# Altium schematic sheet Motor Driver.SchDoc
size 347 x 193 mm; SheetNumber: 5; SheetTotal: 5
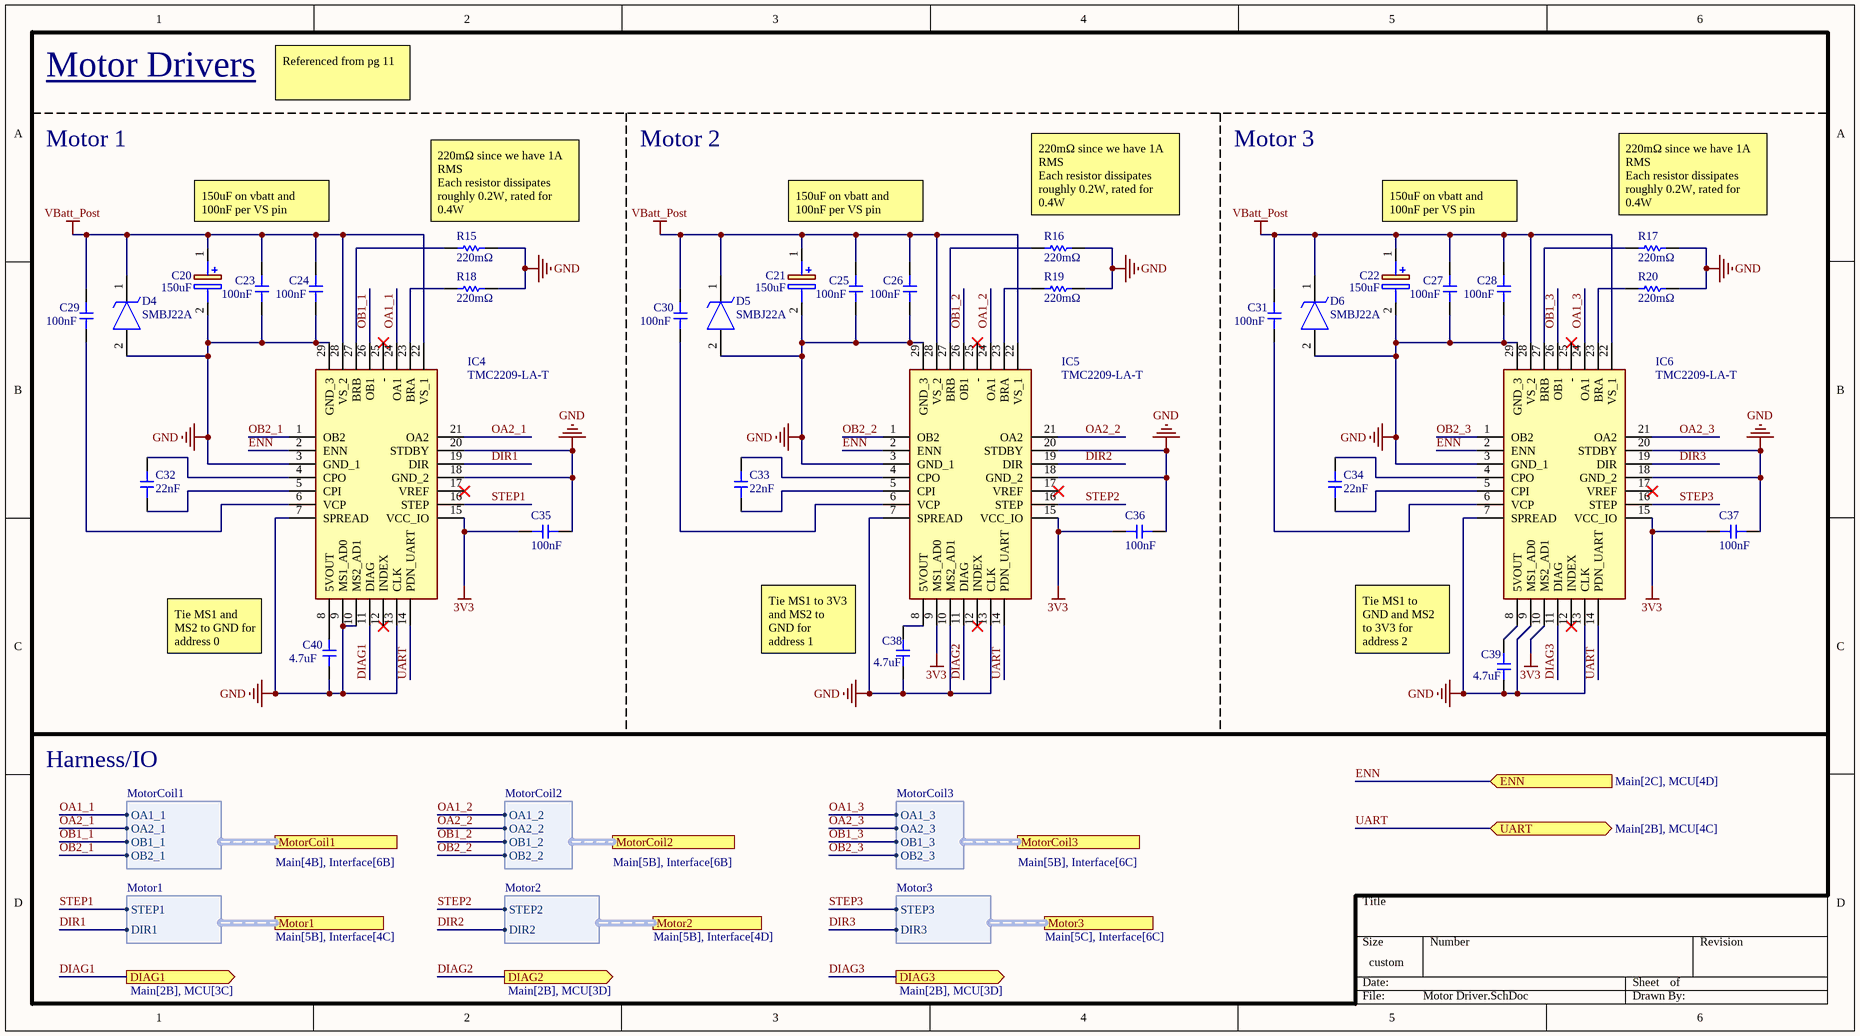
[diagram p0: Motor Driver.SchDoc]

## Parts
C20  150uF  [EEHZA1H680P]
C21  150uF  [EEHZA1H680P]
C22  150uF  [EEHZA1H680P]
C23  Capacitance: 100nF  [CAP-0603]  (hidden comment: CC0603KRX7R9BB104)
C24  Capacitance: 100nF  [CAP-0603]  (hidden comment: CC0603KRX7R9BB104)
C25  Capacitance: 100nF  [CAP-0603]  (hidden comment: CC0603KRX7R9BB104)
C26  Capacitance: 100nF  [CAP-0603]  (hidden comment: CC0603KRX7R9BB104)
C27  Capacitance: 100nF  [CAP-0603]  (hidden comment: CC0603KRX7R9BB104)
C28  Capacitance: 100nF  [CAP-0603]  (hidden comment: CC0603KRX7R9BB104)
C29  Capacitance: 100nF  [CAP-0603]  (hidden comment: CC0603KRX7R9BB104)
C30  Capacitance: 100nF  [CAP-0603]  (hidden comment: CC0603KRX7R9BB104)
C31  Capacitance: 100nF  [CAP-0603]  (hidden comment: CC0603KRX7R9BB104)
C32  Capacitance: 22nF  [CAP-0603]  (hidden comment: CL10B223KB8NNNC)
C33  Capacitance: 22nF  [CAP-0603]  (hidden comment: CL10B223KB8NNNC)
C34  Capacitance: 22nF  [CAP-0603]  (hidden comment: CL10B223KB8NNNC)
C35  Capacitance: 100nF  [CAP-0603]  (hidden comment: CC0603KRX7R9BB104)
C36  Capacitance: 100nF  [CAP-0603]  (hidden comment: CC0603KRX7R9BB104)
C37  Capacitance: 100nF  [CAP-0603]  (hidden comment: CC0603KRX7R9BB104)
C38  Capacitance: 4.7uF  [CAP-0603]  (hidden comment: CL10A475KO8NNNC)
C39  Capacitance: 4.7uF  [CAP-0603]  (hidden comment: CL10A475KO8NNNC)
C40  Capacitance: 4.7uF  [CAP-0603]  (hidden comment: CL10A475KO8NNNC)
D4  SMBJ22A  [SMBJ12A]
D5  SMBJ22A  [SMBJ12A]
D6  SMBJ22A  [SMBJ12A]
IC4  TMC2209-LA-T  [QFN50P500X500X90-29N-D]
IC5  TMC2209-LA-T  [QFN50P500X500X90-29N-D]
IC6  TMC2209-LA-T  [QFN50P500X500X90-29N-D]
R15  220mΩ  [RESC1608X55N]
R16  220mΩ  [RESC1608X55N]
R17  220mΩ  [RESC1608X55N]
R18  220mΩ  [RESC1608X55N]
R19  220mΩ  [RESC1608X55N]
R20  220mΩ  [RESC1608X55N]

## Ports
DIAG1 (out, see Main[2B], MCU[3C]), DIAG2 (out, see Main[2B], MCU[3D]), DIAG3 (out, see Main[2B], MCU[3D]), ENN (in, see Main[2C], MCU[4D]), Motor1 (harness Motor1, see Main[5B], Interface[4C]), Motor2 (harness Motor2, see Main[5B], Interface[4D]), Motor3 (harness Motor3, see Main[5C], Interface[6C]), MotorCoil1 (harness MotorCoil1, see Main[4B], Interface[6B]), MotorCoil2 (harness MotorCoil2, see Main[5B], Interface[6B]), MotorCoil3 (harness MotorCoil3, see Main[5B], Interface[6C]), UART (bidir, see Main[2B], MCU[4C])

## Harnesses
MotorCoil1: OA1_1, OA2_1, OB1_1, OB2_1
MotorCoil2: OA1_2, OA2_2, OB1_2, OB2_2
MotorCoil3: OA1_3, OA2_3, OB1_3, OB2_3
Motor1: STEP1, DIR1
Motor2: STEP2, DIR2
Motor3: STEP3, DIR3

## Nets
3V3: C35.1 C36.1 C37.1 IC4.15(VCC_IO) IC5.9(MS1_AD0) IC5.15(VCC_IO) IC6.10(MS2_AD1) IC6.15(VCC_IO)
GND: C20.2(-) C21.2(-) C22.2(-) C23.1 C24.1 C25.1 C26.1 C27.1 C28.1 C35.2 C36.2 C37.2 C38.1 C39.1 C40.1 D4.2(A) D5.2(A) D6.2(A) IC4.3(GND_1) IC4.7(SPREAD) IC4.9(MS1_AD0) IC4.10(MS2_AD1) IC4.13(CLK) IC4.18(GND_2) IC4.20(STDBY) IC4.29(GND_3) IC5.3(GND_1) IC5.7(SPREAD) IC5.10(MS2_AD1) IC5.13(CLK) IC5.18(GND_2) IC5.20(STDBY) IC5.29(GND_3) IC6.3(GND_1) IC6.7(SPREAD) IC6.9(MS1_AD0) IC6.13(CLK) IC6.18(GND_2) IC6.20(STDBY) IC6.29(GND_3) R15.2 R16.2 R17.2 R18.2 R19.2 R20.2
VBatt_Post: C20.1(+) C21.1(+) C22.1(+) C23.2 C24.2 C25.2 C26.2 C27.2 C28.2 C29.2 C30.2 C31.2 D4.1(K) D5.1(K) D6.1(K) IC4.22(VS_1) IC4.28(VS_2) IC5.22(VS_1) IC5.28(VS_2) IC6.22(VS_1) IC6.28(VS_2)
DIAG1: IC4.11(DIAG) ; port DIAG1
DIAG2: IC5.11(DIAG) ; port DIAG2
DIAG3: IC6.11(DIAG) ; port DIAG3
DIR1: IC4.19(DIR) ; port Motor1.DIR1
DIR2: IC5.19(DIR) ; port Motor2.DIR2
DIR3: IC6.19(DIR) ; port Motor3.DIR3
ENN: IC4.2(ENN) IC5.2(ENN) IC6.2(ENN) ; port ENN
OA1_1: IC4.24(OA1) ; port MotorCoil1.OA1_1
OA1_2: IC5.24(OA1) ; port MotorCoil2.OA1_2
OA1_3: IC6.24(OA1) ; port MotorCoil3.OA1_3
OA2_1: IC4.21(OA2) ; port MotorCoil1.OA2_1
OA2_2: IC5.21(OA2) ; port MotorCoil2.OA2_2
OA2_3: IC6.21(OA2) ; port MotorCoil3.OA2_3
OB1_1: IC4.26(OB1) ; port MotorCoil1.OB1_1
OB1_2: IC5.26(OB1) ; port MotorCoil2.OB1_2
OB1_3: IC6.26(OB1) ; port MotorCoil3.OB1_3
OB2_1: IC4.1(OB2) ; port MotorCoil1.OB2_1
OB2_2: IC5.1(OB2) ; port MotorCoil2.OB2_2
OB2_3: IC6.1(OB2) ; port MotorCoil3.OB2_3
STEP1: IC4.16(STEP) ; port Motor1.STEP1
STEP2: IC5.16(STEP) ; port Motor2.STEP2
STEP3: IC6.16(STEP) ; port Motor3.STEP3
UART: IC4.14(PDN_UART) IC5.14(PDN_UART) IC6.14(PDN_UART) ; port UART
NetC29_1: C29.1 IC4.6(VCP)
NetC30_1: C30.1 IC5.6(VCP)
NetC31_1: C31.1 IC6.6(VCP)
NetC32_1: C32.1 IC4.5(CPI)
NetC32_2: C32.2 IC4.4(CPO)
NetC33_1: C33.1 IC5.5(CPI)
NetC33_2: C33.2 IC5.4(CPO)
NetC34_1: C34.1 IC6.5(CPI)
NetC34_2: C34.2 IC6.4(CPO)
NetC38_2: C38.2 IC5.8(5VOUT)
NetC39_2: C39.2 IC6.8(5VOUT)
NetC40_2: C40.2 IC4.8(5VOUT)
NetIC4_23: IC4.23(BRA) R18.1
NetIC4_27: IC4.27(BRB) R15.1
NetIC5_23: IC5.23(BRA) R19.1
NetIC5_27: IC5.27(BRB) R16.1
NetIC6_23: IC6.23(BRA) R20.1
NetIC6_27: IC6.27(BRB) R17.1

Not connected (* = marked no-connect by the designer): IC4 12(INDEX)* 17(VREF)* 25(-)*; IC5 12(INDEX)* 17(VREF)* 25(-)*; IC6 12(INDEX)* 17(VREF)* 25(-)*

## Notes on the sheet
- Motor Drivers <https://www.analog.com/media/en/technical-documentation/data-sheets/tmc2209_datasheet_rev1.09.pdf>
- Referenced from pg 11
- Motor 1
- Motor 2
- Motor 3
- 150uF on vbatt and 100nF per VS pin
- (near R15) 220mΩ since we have 1A RMS
  Each resistor dissipates roughly 0.2W, rated for 0.4W
- (near R16) 220mΩ since we have 1A RMS
  Each resistor dissipates roughly 0.2W, rated for 0.4W
- (near R17) 220mΩ since we have 1A RMS
  Each resistor dissipates roughly 0.2W, rated for 0.4W
- Tie MS1 and MS2 to GND for address 0
- Tie MS1 to 3V3 and MS2 to GND for address 1
- Tie MS1 to GND and MS2 to 3V3 for address 2
- Harness/IO

## Library data of the parts
C20-C22 = EEH-ZA1V151P: Capacitor Polarised, EEH-ZA1V151P; Manufacturer_Name: Panasonic; Datasheet Link: http://industrial.panasonic.com/cdbs/www-data/pdf/RDD0000/ABA0000C1221.pdf; Height: 10.8mm; Manufacturer_Part_Number: EEH-ZA1V151P; Mouser Part Number: 667-EEH-ZA1V151P; Mouser Price/Stock: https://www.mouser.co.uk/ProductDetail/Panasonic/EEH-ZA1V151P?qs=7UCyOFMWVHbEfsj1CtRV9Q%3D%3D
C23-C31 C35-C37 = CC0603KRX7R9BB104: Capacitor, Ceramic (MLCC), 100nF, ±10%, 50V, X7R, ±10%, SMD 0603; Manufacturer: YAGEO; Package Size: 0603; JLCPCB Basic Part: Yes; JLCPCB Part Number: C14663; Supplier 1: LCSC; Category: Capacitors - MLCC; Supplier Part Number 1: C14663; Manufacturer Part Number: CC0603KRX7R9BB104; Tolerance: ±10%; Voltage Rating: 50V; Temperature Coefficient: X7R; RoHS: Yes; ComponentLink1Description: Datasheet; ComponentLink1URL: https://wmsc.lcsc.com/wmsc/upload/file/pdf/v2/lcsc/2211101700_YAGEO-CC0603KRX7R9BB104_C14663.pdf; ComponentLink2Description: JLCPCB Part URL; ComponentLink2URL: https://jlcpcb.com/partdetail/C14663; ComponentLink3Description: LCSC Part URL; ComponentLink3URL: https://lcsc.com/product-detail/Multilayer-Ceramic-Capacitors-MLCC---SMD-SMT_YAGEO-YAGEO-CC0603KRX7R9BB104_C14663.html
C32-C34 = CL10B223KB8NNNC: Capacitor, Ceramic (MLCC), 22nF, ±10%, 50V, X7R, ±10%, SMD 0603; Manufacturer: Samsung Electro-Mechanics; Temperature Rating: -55°C ~ 125°C; Capacitance @ 1V DC Bias: 22.573nF; Capacitance @ 1.2V DC Bias: 22.636nF; Capacitance @ 1.35V DC Bias: 22.685nF; Capacitance @ 1.5V DC Bias: 22.733nF; Capacitance @ 1.8V DC Bias: 22.823nF; Capacitance @ 2.5V DC Bias: 22.946nF; Capacitance @ 3.3V DC Bias: 23.004nF; Capacitance @ 3.7V DC Bias: 23.013nF; Capacitance @ 4.2V DC Bias: 23.008nF; Capacitance @ 5V DC Bias: 22.974nF; Capacitance @ 9V DC Bias: 22.838nF; Capacitance @ 12V DC Bias: 22.650nF; Capacitance @ 15V DC Bias: 22.427nF; Capacitance @ 24V DC Bias: 21.437nF; Capacitance @ 36V DC Bias: 19.554nF; Capacitance @ 48V DC Bias: 17.020nF; Impedance (0V Bias) @ 100Hz: 7.5E+04Ω; Impedance (0V Bias) @ 500Hz: 1.52E+04Ω; Impedance (0V Bias) @ 1kHz: 7.64E+03Ω; Impedance (0V Bias) @ 5kHz: 1.55E+03Ω; Impedance (0V Bias) @ 10kHz: 779Ω; Impedance (0V Bias) @ 50kHz: 158Ω; Impedance (0V Bias) @ 100kHz: 79.4Ω; Impedance (0V Bias) @ 500kHz: 16.1Ω; Impedance (0V Bias) @ 1MHz: 8.09Ω; Impedance (0V Bias) @ 5MHz: 1.63Ω; Impedance (0V Bias) @ 10MHz: 0.801Ω; Impedance (0V Bias) @ 50MHz: 0.0651Ω; Impedance (0V Bias) @ 100MHz: 0.206Ω; Impedance (0V Bias) @ 500MHz: 0.865Ω; Impedance (0V Bias) @ 1GHz: 1.65Ω; Impedance (0V Bias) @ 2GHz: 4.18Ω; Impedance (0V Bias) @ 5GHz: 9.53Ω; Package Size: 0603; JLCPCB Basic Part: Yes; JLCPCB Part Number: C21122; Supplier 1: LCSC; Category: Capacitors - MLCC; Supplier Part Number 1: C21122; Manufacturer Part Number: CL10B223KB8NNNC; Tolerance: ±10%; Voltage Rating: 50V; Temperature Coefficient: X7R; RoHS: Yes; ComponentLink1Description: Datasheet; ComponentLink1URL: https://wmsc.lcsc.com/wmsc/upload/file/pdf/v2/lcsc/2304140030_Samsung-Electro-Mechanics-CL10B223KB8NNNC_C21122.pdf; ComponentLink2Description: JLCPCB Part URL; ComponentLink2URL: https://jlcpcb.com/partdetail/C21122; ComponentLink3Description: LCSC Part URL; ComponentLink3URL: https://lcsc.com/product-detail/Multilayer-Ceramic-Capacitors-MLCC---SMD-SMT_Samsung-Electro-Mechanics-Samsung-Electro-Mechanics-CL10B223KB8NNNC_C21122.html; ComponentLink4Description: Samsung Component Library; ComponentLink4URL: https://weblib.samsungsem.com/mlcc/mlcc-ec.do?partNumber=CL10B223KB8NNN
C38-C40 = CL10A475KO8NNNC: Capacitor, Ceramic (MLCC), 4.7uF, ±10%, 16V, X5R, ±10%, SMD 0603; Manufacturer: Samsung Electro-Mechanics; Temperature Rating: -55°C ~ 85°C; Capacitance @ 1V DC Bias: 4.097uF; Capacitance @ 1.2V DC Bias: 4.030uF; Capacitance @ 1.35V DC Bias: 3.972uF; Capacitance @ 1.5V DC Bias: 3.908uF; Capacitance @ 1.8V DC Bias: 3.769uF; Capacitance @ 2.5V DC Bias: 3.406uF; Capacitance @ 3.3V DC Bias: 2.969uF; Capacitance @ 3.7V DC Bias: 2.760uF; Capacitance @ 4.2V DC Bias: 2.508uF; Capacitance @ 5V DC Bias: 2.138uF; Capacitance @ 9V DC Bias: 1.155uF; Capacitance @ 12V DC Bias: 0.873uF; Capacitance @ 15V DC Bias: 0.647uF; Impedance (0V Bias) @ 100Hz: 437Ω; Impedance (0V Bias) @ 500Hz: 90.6Ω; Impedance (0V Bias) @ 1kHz: 46Ω; Impedance (0V Bias) @ 5kHz: 9.51Ω; Impedance (0V Bias) @ 10kHz: 4.83Ω; Impedance (0V Bias) @ 50kHz: 0.996Ω; Impedance (0V Bias) @ 100kHz: 0.505Ω; Impedance (0V Bias) @ 500kHz: 0.104Ω; Impedance (0V Bias) @ 1MHz: 0.05Ω; Impedance (0V Bias) @ 5MHz: 0.011Ω; Impedance (0V Bias) @ 10MHz: 0.0248Ω; Impedance (0V Bias) @ 50MHz: 0.0811Ω; Impedance (0V Bias) @ 100MHz: 0.141Ω; Impedance (0V Bias) @ 500MHz: 0.57Ω; Impedance (0V Bias) @ 1GHz: 1.02Ω; Impedance (0V Bias) @ 2GHz: 2.37Ω; Impedance (0V Bias) @ 5GHz: 4.65Ω; Impedance (16V Bias) @ 100Hz: 3.74E+03Ω; Impedance (16V Bias) @ 500Hz: 758Ω; Impedance (16V Bias) @ 1kHz: 381Ω; Impedance (16V Bias) @ 5kHz: 77.1Ω; Impedance (16V Bias) @ 10kHz: 38.7Ω; Impedance (16V Bias) @ 50kHz: 7.82Ω; Impedance (16V Bias) @ 100kHz: 3.93Ω; Impedance (16V Bias) @ 500kHz: 0.79Ω; Impedance (16V Bias) @ 1MHz: 0.386Ω; Impedance (16V Bias) @ 5MHz: 0.077Ω; Impedance (16V Bias) @ 10MHz: 0.0173Ω; Impedance (16V Bias) @ 50MHz: 0.0836Ω; Impedance (16V Bias) @ 100MHz: 0.142Ω; Impedance (16V Bias) @ 500MHz: 0.585Ω; Impedance (16V Bias) @ 1GHz: 1.06Ω; Impedance (16V Bias) @ 2GHz: 2.36Ω; Impedance (16V Bias) @ 5GHz: 4.63Ω; Package Size: 0603; JLCPCB Basic Part: Yes; JLCPCB Part Number: C19666; Supplier 1: LCSC; Category: Capacitors - MLCC; Supplier Part Number 1: C19666; Manufacturer Part Number: CL10A475KO8NNNC; Tolerance: ±10%; Voltage Rating: 16V; Temperature Coefficient: X5R; RoHS: Yes; ComponentLink1Description: Datasheet; ComponentLink1URL: https://wmsc.lcsc.com/wmsc/upload/file/pdf/v2/lcsc/2304140030_Samsung-Electro-Mechanics-CL10A475KO8NNNC_C19666.pdf; ComponentLink2Description: JLCPCB Part URL; ComponentLink2URL: https://jlcpcb.com/partdetail/C19666; ComponentLink3Description: LCSC Part URL; ComponentLink3URL: https://lcsc.com/product-detail/Multilayer-Ceramic-Capacitors-MLCC---SMD-SMT_Samsung-Electro-Mechanics-Samsung-Electro-Mechanics-CL10A475KO8NNNC_C19666.html; ComponentLink4Description: Samsung Component Library; ComponentLink4URL: https://weblib.samsungsem.com/mlcc/mlcc-ec.do?partNumber=CL10A475KO8NNN
D4-D6 = SMBJ22A: TVS Diode (Uni-directional); Manufacturer_Name: STMicroelectronics; Datasheet Link: https://www.st.com/resource/en/datasheet/smbj12a.pdf; Height: 2.45mm; Manufacturer_Part_Number: SMBJ22A
IC4-IC6 = TMC2209-LA-T: Integrated Circuit; Manufacturer_Name: Analog Devices; Datasheet Link: https://www.analog.com/media/en/technical-documentation/data-sheets/TMC2209_datasheet_rev1.09.pdf; Height: 0.9mm; Manufacturer_Part_Number: TMC2209-LA-T; Mouser Part Number: 700-TMC2209-LA-T; Mouser Price/Stock: https://www.mouser.co.uk/ProductDetail/ADI-Trinamic/TMC2209-LA-T?qs=TiOZkKH1s2Qz5AVGoa6OOQ%3D%3D; Arrow Part Number: TMC2209-LA-T; Arrow Price/Stock: https://www.arrow.com/en/products/tmc2209-la-t/analog-devices.html?utm_currency=USD&region=nac
R15-R20 = PE0603FRF470R22L: RES 0.22 OHM 1% 2/5W 0603